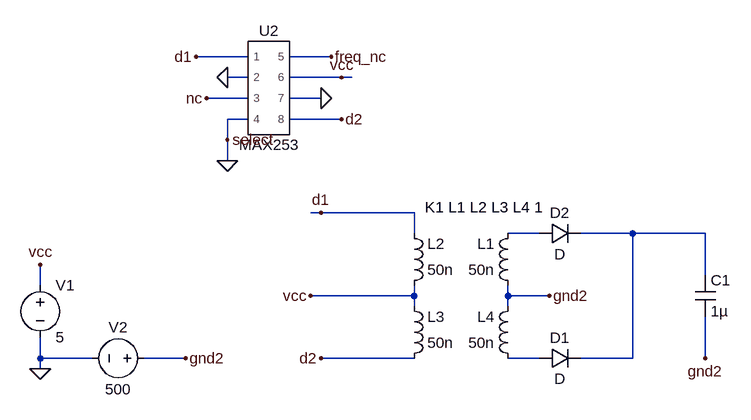
[diagram p0: schematic Medicao_AMC1301.asc]
Medicao_AMC1301.asc, the LTspice schematic file:
Version 4.1
SHEET 1 880 680
WIRE -176 -352 -256 -352
WIRE -48 -352 -112 -352
WIRE -176 -320 -208 -320
WIRE -32 -320 -112 -320
WIRE -16 -320 -32 -320
WIRE -176 -288 -240 -288
WIRE -64 -288 -112 -288
WIRE -176 -256 -208 -256
WIRE -32 -256 -112 -256
WIRE -208 -224 -208 -256
WIRE -208 -192 -208 -224
WIRE -64 -112 -80 -112
WIRE 80 -112 -64 -112
WIRE 80 -80 80 -112
WIRE 272 -80 224 -80
WIRE 416 -80 336 -80
WIRE 528 -80 416 -80
WIRE 528 -16 528 -80
WIRE -496 0 -496 -32
WIRE 80 16 80 0
WIRE 80 16 -80 16
WIRE 224 16 224 0
WIRE 288 16 224 16
WIRE 80 32 80 16
WIRE 224 32 224 16
WIRE -496 112 -496 80
WIRE -416 112 -496 112
WIRE -272 112 -336 112
WIRE 80 112 -64 112
WIRE 272 112 224 112
WIRE 416 112 416 -80
WIRE 416 112 336 112
WIRE 528 112 528 48
WIRE -496 128 -496 112
FLAG -496 128 0
FLAG -496 -32 vcc
FLAG -32 -320 vcc
FLAG -32 -256 d2
FLAG -256 -352 d1
FLAG -208 -320 0
FLAG -64 -288 0
FLAG -208 -192 0
FLAG -208 -224 select
FLAG -48 -352 freq_nc
FLAG -240 -288 nc
FLAG -80 16 vcc
FLAG -64 -112 d1
FLAG -64 112 d2
FLAG 288 16 gnd2
FLAG -272 112 gnd2
FLAG 528 112 gnd2
SYMBOL ind 240 16 R180
WINDOW 0 36 80 Left 2
WINDOW 3 36 40 Left 2
SYMATTR InstName L1
SYMATTR Value 50n
SYMATTR Type ind
SYMATTR SpiceLine Rser=1m
SYMBOL ind 64 16 M180
WINDOW 0 36 80 Left 2
WINDOW 3 36 40 Left 2
SYMATTR InstName L2
SYMATTR Value 50n
SYMATTR Type ind
SYMATTR SpiceLine Rser=1m
SYMBOL MAX253 -144 -304 R0
SYMATTR InstName U2
SYMBOL voltage -496 -16 R0
WINDOW 123 0 0 Left 0
WINDOW 39 0 0 Left 0
SYMATTR InstName V1
SYMATTR Value 5
SYMBOL ind 64 128 M180
WINDOW 0 36 80 Left 2
WINDOW 3 36 40 Left 2
SYMATTR InstName L3
SYMATTR Value 50n
SYMATTR Type ind
SYMATTR SpiceLine Rser=1m
SYMBOL voltage -320 112 R90
WINDOW 0 -32 56 VBottom 2
WINDOW 3 32 56 VTop 2
WINDOW 123 0 0 Left 0
WINDOW 39 0 0 Left 0
SYMATTR InstName V2
SYMATTR Value 500
SYMBOL diode 272 -64 R270
WINDOW 0 32 32 VTop 2
WINDOW 3 0 32 VBottom 2
SYMATTR InstName D2
SYMBOL ind 240 128 R180
WINDOW 0 36 80 Left 2
WINDOW 3 36 40 Left 2
SYMATTR InstName L4
SYMATTR Value 50n
SYMATTR Type ind
SYMATTR SpiceLine Rser=1m
SYMBOL diode 272 128 R270
WINDOW 0 32 32 VTop 2
WINDOW 3 0 32 VBottom 2
SYMATTR InstName D1
SYMBOL cap 512 -16 R0
SYMATTR InstName C1
SYMATTR Value 1µ
TEXT 96 -120 Left 2 !K1 L1 L2 L3 L4 1

The netlist it stands for:
* Medicao_AMC1301.asc
L1 gnd2 N001 50n Rser=1m
L2 vcc d1 50n Rser=1m
X§U2 d1 0 nc 0 freq_nc vcc 0 d2 MAX253  ; pins 1 2 3 4 5 6 7 8
V1 vcc 0 5
L3 d2 vcc 50n Rser=1m
V2 gnd2 0 500
D2 N001 N002 D
L4 N003 gnd2 50n Rser=1m
D1 N003 N002 D
C1 N002 gnd2 1µ
.model D D
.lib standard.dio
K1 L1 L2 L3 L4 1
.lib max253.lib
.backanno
.end